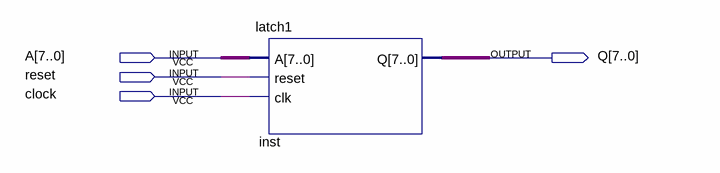
[diagram p0: schematic sheet]
// Quartus schematic latch1_diag.bdf as structural Verilog: 1 symbols, 4 pins
module latch1_diag (
  input  [7:0] A,
  input  reset,
  input  clock,
  output [7:0] Q
);

  latch1 inst (.A(A), .reset(reset), .clk(clock), .Q(Q));
endmodule
